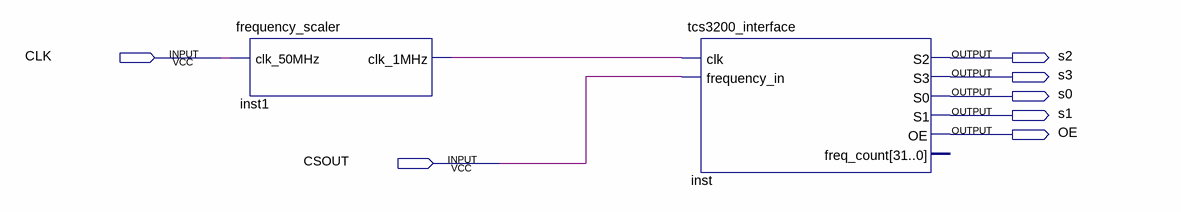
[diagram p0: schematic sheet]
// Quartus schematic color.bdf as structural Verilog: 2 symbols, 7 pins
module color (
  input  CLK,
  input  CSOUT,
  output s2,
  output s3,
  output s0,
  output s1,
  output OE
);

  wire inst1_clk_1mhz;

  frequency_scaler inst1 (.clk_50MHz(CLK), .clk_1MHz(inst1_clk_1mhz));
  tcs3200_interface inst (
    .clk(inst1_clk_1mhz), .frequency_in(CSOUT), .S2(s2), .S3(s3), .S0(s0), .S1(s1), .OE(OE));  // open: freq_count
endmodule
